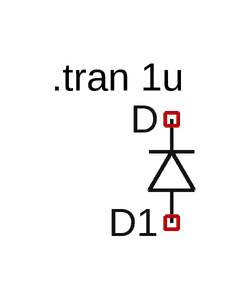
[diagram p0: schematic test_dio.asc]
test_dio.asc, the LTspice schematic file:
Version 4
SHEET 1 800 600
SYMBOL diode 100 100 R180
SYMATTR InstName D1
TEXT 10 10 Left 2 !.tran 1u

The netlist it stands for:
* test_dio.asc
D1 NC_01 NC_02 D
.model D D
.lib standard.dio
.tran 1u
.backanno
.end